# Altium schematic sheet Vibration_Datalogger_1.SchDoc: Title (part 7 of 7)
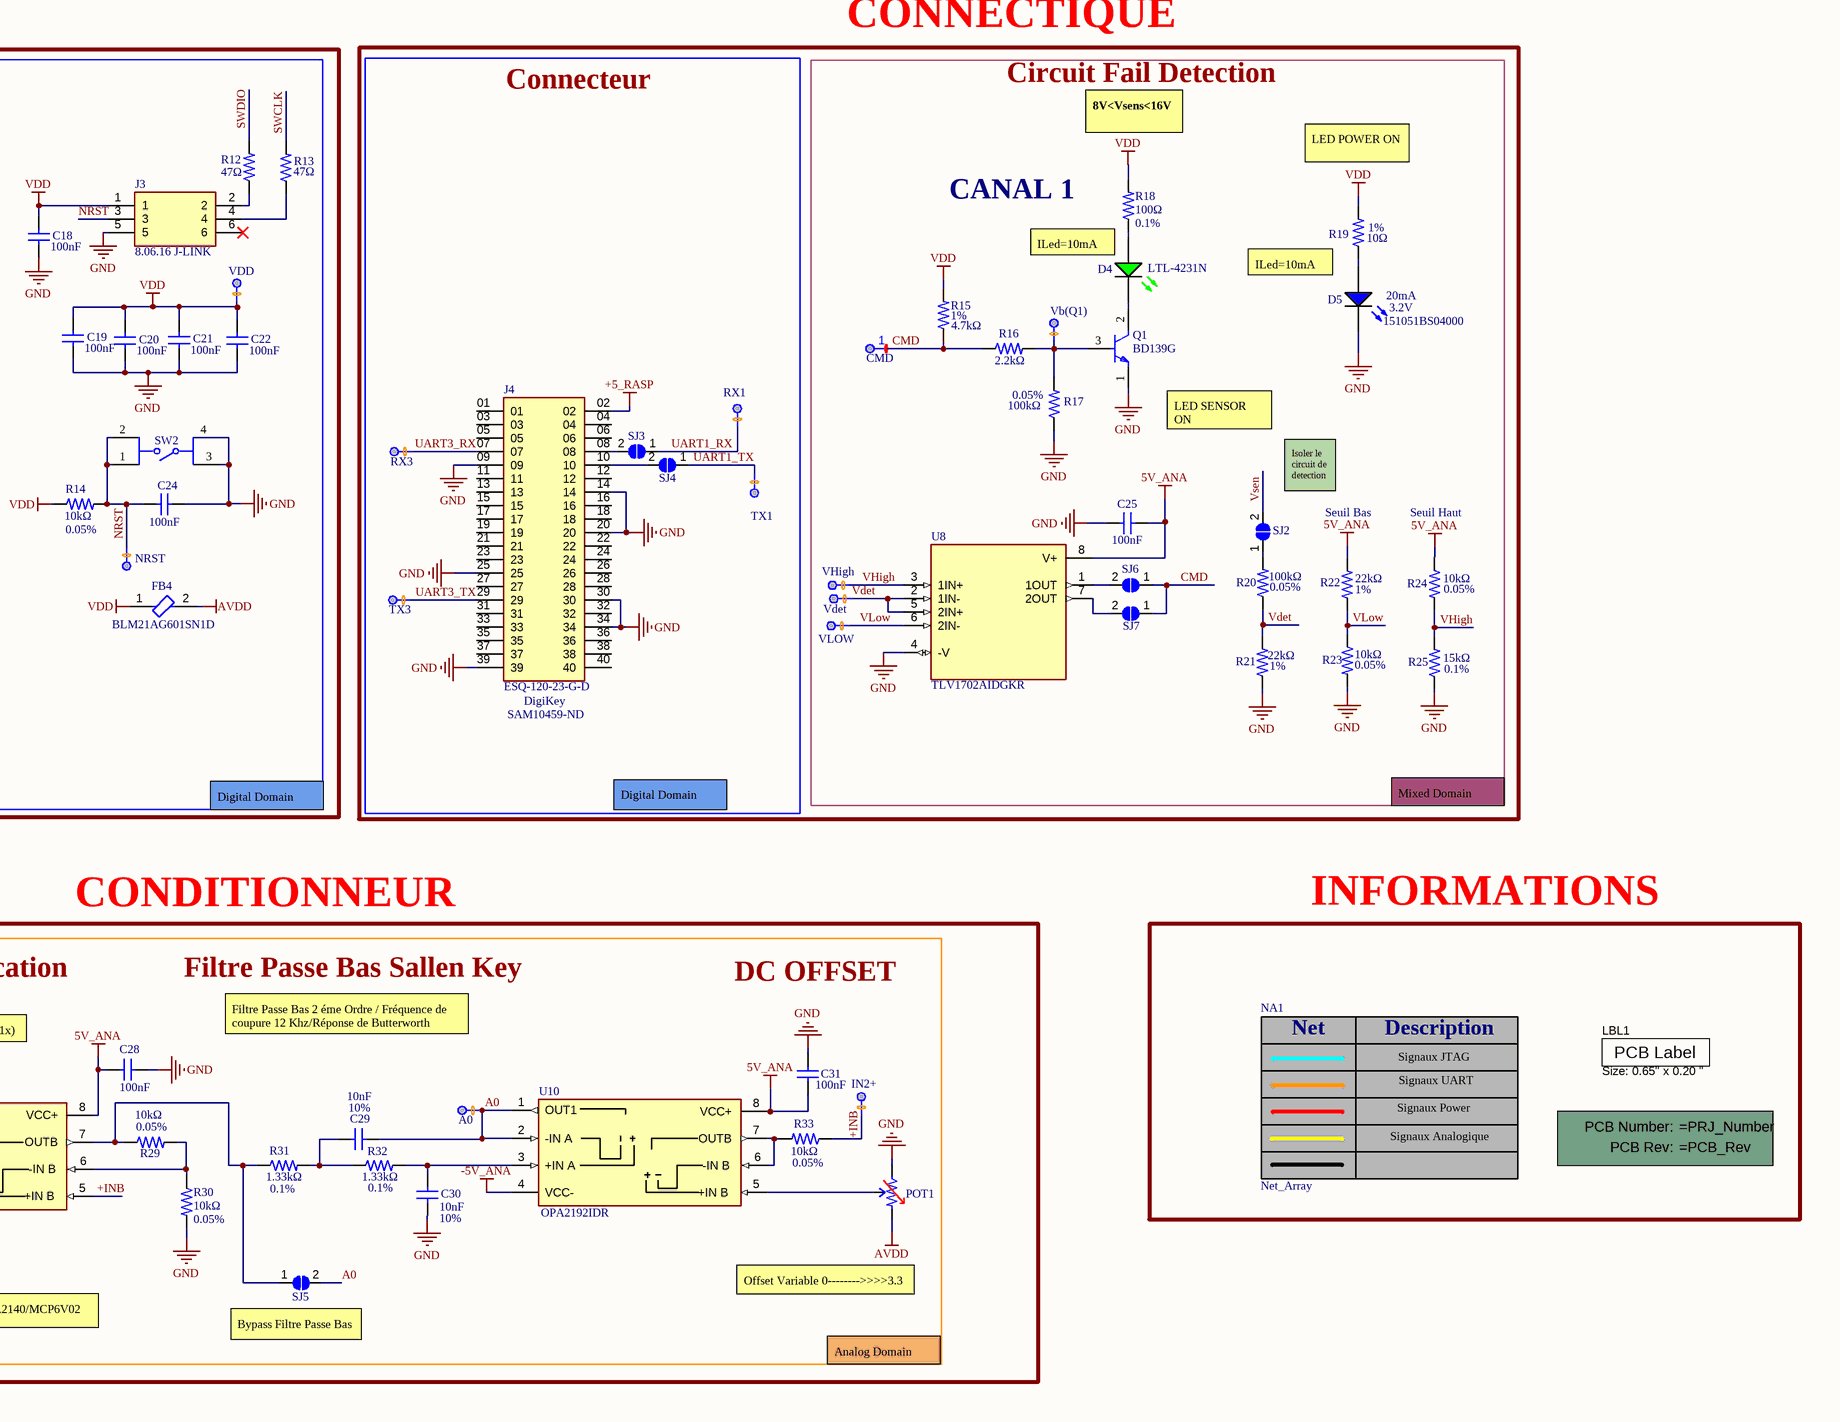
[diagram p9: Vibration_Datalogger_1.SchDoc, bottom right]

## Library data of the parts (continued)
U9 U10 = OPA2192IDR: IC OPAMP GP 2 CIRCUIT 8SOIC; Manufacturer: STMicroelectronics; Manufacturer Part Number: TL082IDT; Manufacturer Lifecycle Status: ACTIVE; Bandwidth: 4MHz; Common Mode Rejection Ratio: 80dB; Input Bias Current: 200pA; Input Offset Voltage (Vos): 13mV; Max Dual Supply Voltage: 18V; Max Power Dissipation: 680mW; Max Supply Current: 2.5mA; Min Dual Supply Voltage: 3V; Min Supply Voltage: 6V; Nominal Supply Current: 1.4mA; Number of Amplifiers: 2; Operating Supply Voltage: 15V; Output Current: 40mA; Slew Rate: 8V/µs; Voltage Gain: 106.02dB; Case/Package: SO; China RoHS: Compliant; Contact Plating: Tin; Country of Origin: Mainland China, Morocco; Export Control Classification Number (ECCN) Code: EAR99; Gain Bandwidth Product: 4MHz; Height: 1.25mm; Height - Seated (Max): 1.75mm; Harmonized Tariff Schedule (HTS) Code: 8542.33.00.01; Introduction Date: 1980-01-04; Length: 4.9mm; Lifecycle Status: Production; Max Operating Temperature: 105°C; Max Supply Voltage: 18V; Min Operating Temperature: -40°C; Mount: Surface Mount; Number of Channels: 2; Number of Circuits: 2; Number of Elements: 2; Number of Pins: 8; Number of Terminals: 2; Operating Supply Current: 1.4mA; Output Current per Channel: 40mA; Packaging: Tape and Reel; Power Dissipation: 680mW; Radiation Hardening: No; REACH SVHC: Yes; Schedule B: 8542330000, 8542330000|8542330000|8542330000|8542330000|8542330000|8542330000|8542330000|8542330000|8542330000|8542330000|8542330000|8542330000|8542330000|8542330000|8542330000|8542330000|8542330000|8542330000|8542330000|8542330000|8542330000|8542330000|8542330000|85; Temperature Grade: Industrial; Terminal Pitch: 1.27mm; Unity Gain Bandwidth Product: 4MHz; Width: 3.9mm; ComponentLink1URL: https://datasheet.octopart.com:443/TL082IDT-STMicroelectronics-datasheet-68295580.pdf?src-supplier=Newark; ComponentLink1Description: https://datasheet.octopart.com:443/TL082IDT-STMicroelectronics-datasheet-68295580.pdf?src-supplier=Newark; ComponentLink2URL: https://datasheet.octopart.com:443/TL082IDT-STMicroelectronics-datasheet-10692279.pdf?src-supplier=Newark; ComponentLink2Description: https://datasheet.octopart.com:443/TL082IDT-STMicroelectronics-datasheet-10692279.pdf?src-supplier=Newark; ComponentLink3URL: https://datasheet.octopart.com:443/TL082IDT-STMicroelectronics-datasheet-37002800.pdf?src-supplier=element14+APAC; ComponentLink3Description: https://datasheet.octopart.com:443/TL082IDT-STMicroelectronics-datasheet-37002800.pdf?src-supplier=element14+APAC; ComponentLink4URL: https://datasheet.octopart.com:443/TL082IDT-STMicroelectronics-datasheet-5315494.pdf?src-supplier=STMicroelectronics; ComponentLink4Description: https://datasheet.octopart.com:443/TL082IDT-STMicroelectronics-datasheet-5315494.pdf?src-supplier=STMicroelectronics; ComponentLink5URL: https://datasheet.octopart.com:443/TL082IDT-STMicroelectronics-datasheet-20031.pdf?src-supplier=Sierra+IC; ComponentLink5Description: https://datasheet.octopart.com:443/TL082IDT-STMicroelectronics-datasheet-20031.pdf?src-supplier=Sierra+IC; ComponentLink6URL: https://datasheet.octopart.com:443/TL082IDT-STMicroelectronics-datasheet-14138407.pdf?src-supplier=iiiC; ComponentLink6Description: https://datasheet.octopart.com:443/TL082IDT-STMicroelectronics-datasheet-14138407.pdf?src-supplier=iiiC; Category: Amplifiers - Op Amps, Buffer, Instrumentation; Lead Free: Lead Free; Thickness: 1.58mm; ComponentLink7URL: https://datasheet.octopart.com:443/OPA2192IDR-Texas-Instruments-datasheet-41216690.pdf?src-supplier=Texas+Instruments; ComponentLink7Description: https://datasheet.octopart.com:443/OPA2192IDR-Texas-Instruments-datasheet-41216690.pdf?src-supplier=Texas+Instruments; ComponentLink8URL: https://octopart.com:443/opatz8j6/c1?t=2jMPwhJaFj21i54Nabx5wcBwzc_v34gRnVrgDQ7eoTPi6NA-KLSm2uSIBq4XMvkakJrwpjUok_iH5xNbqqgCjQHATgNagnWJ1GBKhYwvDjzxIebgjcBKya2R1xlzTxGnyXFKqQU3SisWdQfHaW__C_MbdE4_ZQ7vmsF44oQ_12mJHVIUpozdPche9huG8eP8gFv-vuS7pdJ7u4vGdUzf5gxgYo936ChnChzKCxlAOP2qNn2hOVAUdpol2nRIQsLgsA4TAAZho4OqyIkKr-xneLZ_sFFifMNCA69dyKZbDpzOhpbS9-Z9Rqoxad8quOtMa2QkPYzIb9-UhzkV0iAVoOIs8qtH9HHyo4x-P8sbbqVwKESVmCagTjFNAgp_124KubOeTSI&src-supplier=Texas+Instruments; ComponentLink8Description: https://octopart.com:443/opatz8j6/c1?t=2jMPwhJaFj21i54Nabx5wcBwzc_v34gRnVrgDQ7eoTPi6NA-KLSm2uSIBq4XMvkakJrwpjUok_iH5xNbqqgCjQHATgNagnWJ1GBKhYwvDjzxIebgjcBKya2R1xlzTxGnyXFKqQU3SisWdQfHaW__C_MbdE4_ZQ7vmsF44oQ_12mJHVIUpozdPche9huG8eP8gFv-vuS7pdJ7u4vGdUzf5gxgYo936ChnChzKCxlAOP2qNn2hOVAUdpol2nRIQsLgsA4TAAZho4OqyIkKr-xneLZ_sFFifMNCA69dyKZbDpzOhpbS9-Z9Rqoxad8quOtMa2QkPYzIb9-UhzkV0iAVoOIs8qtH9HHyo4x-P8sbbqVwKESVmCagTjFNAgp_124KubOeTSI&src-supplier=Texas+Instruments; ComponentLink9URL: https://datasheet.octopart.com:443/OPA2192IDR-Texas-Instruments-datasheet-38965043.pdf?src-supplier=Texas+Instruments; ComponentLink9Description: https://datasheet.octopart.com:443/OPA2192IDR-Texas-Instruments-datasheet-38965043.pdf?src-supplier=Texas+Instruments; ComponentLink10URL: https://datasheet.octopart.com:443/OPA2192IDR-Texas-Instruments-datasheet-38229673.pdf?src-supplier=Texas+Instruments; ComponentLink10Description: https://datasheet.octopart.com:443/OPA2192IDR-Texas-Instruments-datasheet-38229673.pdf?src-supplier=Texas+Instruments; ComponentLink11URL: https://datasheet.octopart.com:443/OPA2192IDR-Texas-Instruments-datasheet-21773461.pdf?src-supplier=Texas+Instruments; ComponentLink11Description: https://datasheet.octopart.com:443/OPA2192IDR-Texas-Instruments-datasheet-21773461.pdf?src-supplier=Texas+Instruments; ComponentLink12URL: https://sigma.octopart.com:443/49249642/technical_drawing/Texas-Instruments-OPA2192IDR.pdf?src-supplier=Texas+Instruments; ComponentLink12Description: https://sigma.octopart.com:443/49249642/technical_drawing/Texas-Instruments-OPA2192IDR.pdf?src-supplier=Texas+Instruments; ComponentLink13URL: https://datasheet.octopart.com:443/OPA2192IDR-Texas-Instruments-datasheet-61016689.pdf?src-supplier=element14+APAC; ComponentLink13Description: https://datasheet.octopart.com:443/OPA2192IDR-Texas-Instruments-datasheet-61016689.pdf?src-supplier=element14+APAC; ComponentLink14URL: https://datasheet.octopart.com:443/OPA2192IDR-Texas-Instruments-datasheet-43921497.pdf?src-supplier=element14+APAC; ComponentLink14Description: https://datasheet.octopart.com:443/OPA2192IDR-Texas-Instruments-datasheet-43921497.pdf?src-supplier=element14+APAC; ComponentLink15URL: https://datasheet.octopart.com:443/OPA2192IDR-Texas-Instruments-datasheet-48370340.pdf?src-supplier=element14+APAC; ComponentLink15Description: https://datasheet.octopart.com:443/OPA2192IDR-Texas-Instruments-datasheet-48370340.pdf?src-supplier=element14+APAC; ComponentLink16URL: https://datasheet.octopart.com:443/OPA2192IDR-Texas-Instruments-datasheet-165810930.pdf?src-supplier=LCSC; ComponentLink16Description: https://datasheet.octopart.com:443/OPA2192IDR-Texas-Instruments-datasheet-165810930.pdf?src-supplier=LCSC; ComponentLink17URL: https://datasheet.octopart.com:443/OPA2192IDR-Texas-Instruments-datasheet-159115559.pdf?src-supplier=LCSC; ComponentLink17Description: https://datasheet.octopart.com:443/OPA2192IDR-Texas-Instruments-datasheet-159115559.pdf?src-supplier=LCSC; ComponentLink18URL: http://sigma.octopart.com:80/reach_statement/Texas-Instruments-company-64.pdf?src-supplier=Compliance+Statements; ComponentLink18Description: http://sigma.octopart.com:80/reach_statement/Texas-Instruments-company-64.pdf?src-supplier=Compliance+Statements; ComponentLink19URL: http://sigma.octopart.com:80/conflict_mineral_statement/Texas-Instruments-company-63.pdf?src-supplier=Compliance+Statements; ComponentLink19Description: http://sigma.octopart.com:80/conflict_mineral_statement/Texas-Instruments-company-63.pdf?src-supplier=Compliance+Statements; Supplier Part Number 1: 296-42106-6-ND; Supplier 1: DigiKey